# Altium schematic sheet Connector.SchDoc
size A4
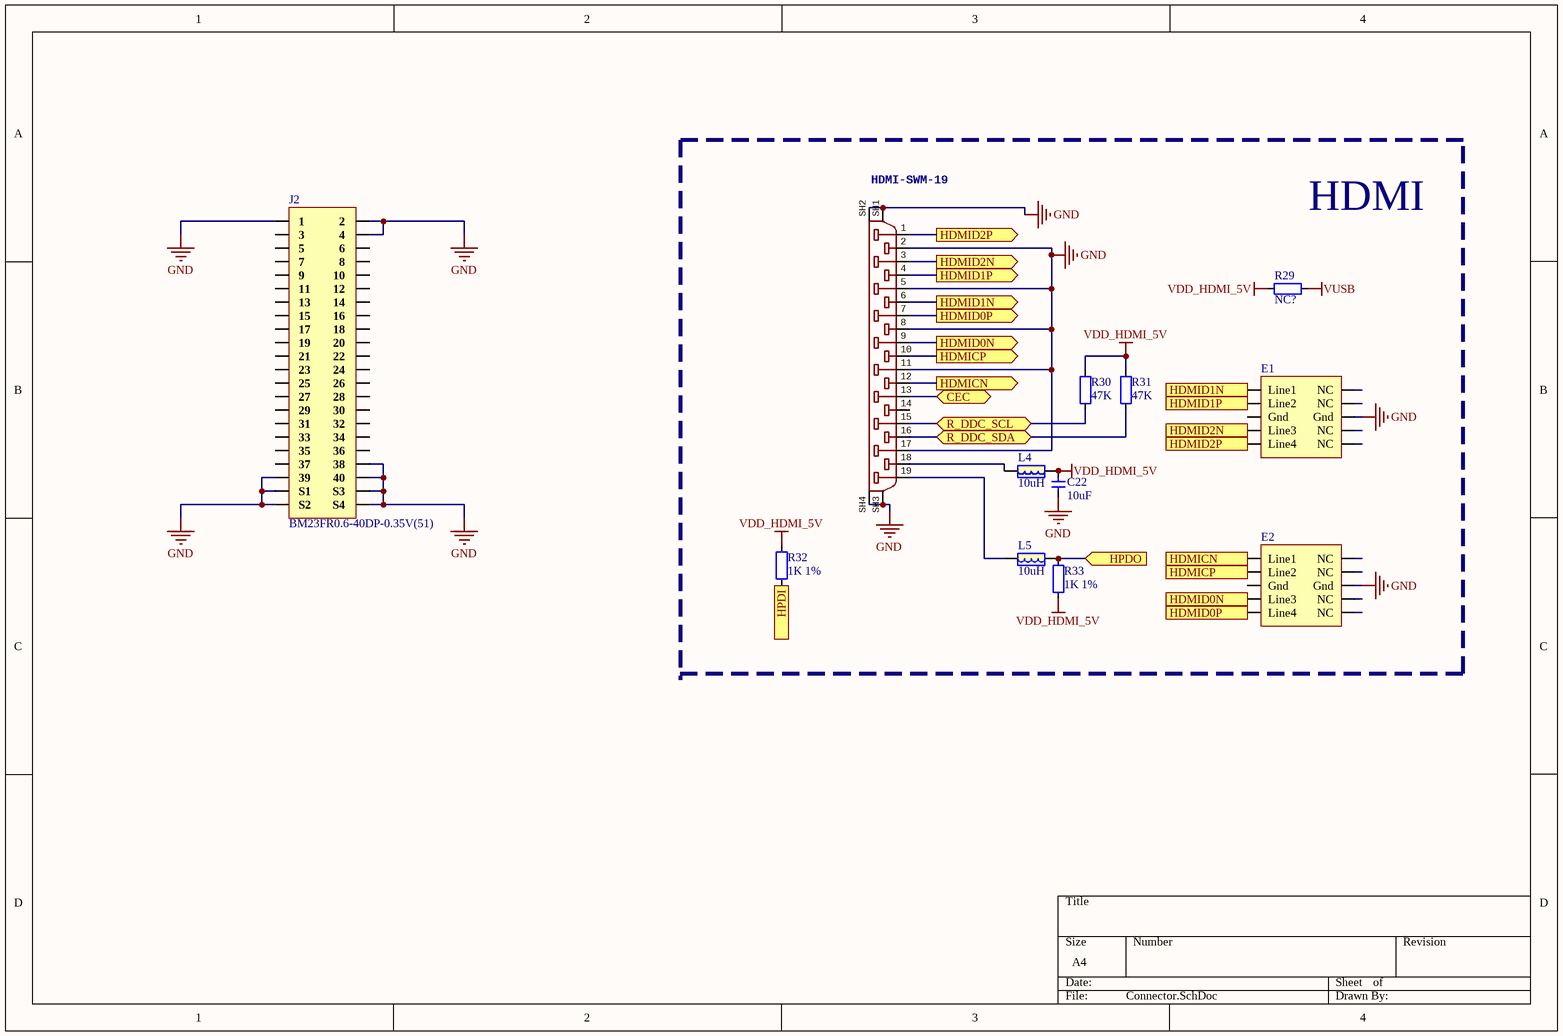
[diagram p0: Connector.SchDoc]

## Parts
C22  10uF  [CAP_0402]
E1  E?  [DFN-2510]  (value not drawn)
E2  E?  [DFN-2510]  (value not drawn)
HDMI?  HDMI-SWM-19  [HDMI-SWM-19]
J2  BM23FR0.6-40DP-0.35V(51)  [BM23FR0.6-40DP-0.35V(51)]
L4  10uH  [0805-L]
L5  10uH  [0805-L]
R29  NC?  [RES_0402]
R30  47K  [RES_0402]
R31  47K  [RES_0402]
R32  1K 1%  [RES_0402]
R33  1K 1%  [RES_0402]

## Ports
CEC (bidir), HDMICN (out), HDMICP (out), HDMID0N (out), HDMID0P (out), HDMID1N (out), HDMID1P (out), HDMID2N (out), HDMID2P (out), HPDI (out), HPDO (in), R_DDC_SCL (bidir), R_DDC_SDA (bidir)

## Nets
GND: C22.1 E1.8(Gnd) E2.8(Gnd) HDMI?.2 HDMI?.5 HDMI?.8 HDMI?.11 HDMI?.17 HDMI?.SH1 HDMI?.SH2 HDMI?.SH3 HDMI?.SH4 J2.1 J2.2 J2.4 J2.38 J2.39 J2.40 J2.S1 J2.S2 J2.S3 J2.S4
VDD_HDMI_5V: C22.2 L4.1 R29.2 R30.2 R31.2 R32.2 R33.1
VUSB: R29.1
CEC: HDMI?.13 ; port CEC
HDMICN: E2.1(Line1) HDMI?.12 ; port HDMICN
HDMICP: E2.2(Line2) HDMI?.10 ; port HDMICP
HDMID0N: E2.4(Line3) HDMI?.9 ; port HDMID0N
HDMID0P: E2.5(Line4) HDMI?.7 ; port HDMID0P
HDMID1N: E1.1(Line1) HDMI?.6 ; port HDMID1N
HDMID1P: E1.2(Line2) HDMI?.4 ; port HDMID1P
HDMID2N: E1.4(Line3) HDMI?.3 ; port HDMID2N
HDMID2P: E1.5(Line4) HDMI?.1 ; port HDMID2P
HPDI: R32.1 ; port HPDI
HPDO: L5.1 R33.2 ; port HPDO
R_DDC_SCL: HDMI?.15 R30.1 ; port R_DDC_SCL
R_DDC_SDA: HDMI?.16 R31.1 ; port R_DDC_SDA
NetHDMI?_18: HDMI?.18 L4.2
NetHDMI?_19: HDMI?.19 L5.2

Not connected (* = marked no-connect by the designer): E1 3(Gnd) 6(NC) 7(NC) 9(NC) 10(NC); E2 3(Gnd) 6(NC) 7(NC) 9(NC) 10(NC); HDMI? 14; J2 3 5 6 7 8 9 10 11 12 13 14 15 16 17 18 19 20 21 22 23 24 25 26 27 28 29 30 31 32 33 34 35 36 37

## Notes on the sheet
- HDMI

## Library data of the parts
C22 = 电容-0402: Capacitor; Value: 0.1u
E1 E2 = AZ1045-04F
HDMI? = HDMI-MC34931HDMI-SWM-19
J2 = BM23FR0.6-40DP-0.35V(51): CONN HDR 40POS SMD GOLD; Manufacturer: Hirose Electric Co Ltd; Item Type: Connector; Manufacturer Part Number: BM23FR0.6-40DP-0.35V(51); Package: Custom
L4 L5 = 电感-0805: 磁珠
R29-R33 = 电阻-0402: Resistor; Value: 22R